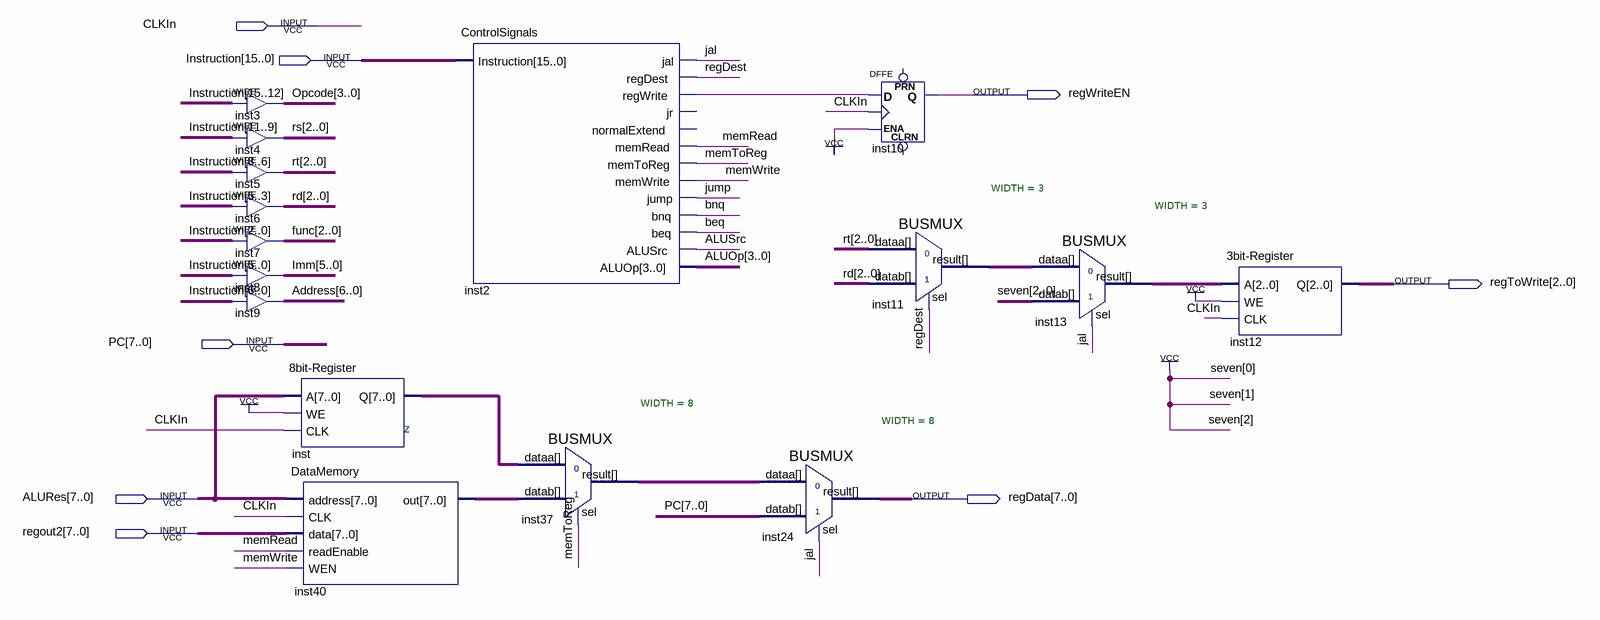
[diagram p0: schematic sheet]
// Quartus schematic Mem.bdf as structural Verilog: 16 symbols, 8 pins
module Mem (
  input  CLKIn,
  input  [15:0] Instruction,
  input  [7:0] PC,
  input  [7:0] ALURes,
  input  [7:0] regout2,
  output regWriteEN,
  output [2:0] regToWrite,
  output [7:0] regData
);

  wire ALUSrc, beq, bnq, inst2_regwrite, jal, jump, memRead, memToReg, memWrite, regDest;
  wire [2:0] func, inst11_result, inst13_result, rd, rs, rt;
  wire [3:0] ALUOp, Opcode;
  wire [5:0] Imm;
  wire [6:0] Address;
  wire [7:0] inst37_result, inst40_out, inst_q;

  assign Opcode = Instruction[15:12];  // WIRE inst3
  assign rs = Instruction[11:9];  // WIRE inst4
  assign rt = Instruction[8:6];  // WIRE inst5
  assign rd = Instruction[5:3];  // WIRE inst6
  assign func = Instruction[2:0];  // WIRE inst7
  assign Imm = Instruction[5:0];  // WIRE inst8
  assign Address = Instruction[6:0];  // WIRE inst9
  \8bit-Register  inst (.A(ALURes), .WE(1'b1), .CLK(CLKIn), .Q(inst_q));
  DataMemory inst40 (
    .address(ALURes), .CLK(CLKIn), .data(regout2), .readEnable(memRead), .WEN(memWrite), .out(inst40_out));
  ControlSignals inst2 (
    .Instruction(Instruction), .jal(jal), .regDest(regDest), .regWrite(inst2_regwrite), .memRead(memRead),
    .memToReg(memToReg), .memWrite(memWrite), .jump(jump), .bnq(bnq), .beq(beq), .ALUSrc(ALUSrc),
    .ALUOp(ALUOp));  // open: jr, normalExtend
  BUSMUX #(.WIDTH(8)) inst37 (.datab(inst40_out), .sel(memToReg), .dataa(inst_q), .result(inst37_result));
  BUSMUX #(.WIDTH(8)) inst24 (.datab(PC), .sel(jal), .dataa(inst37_result), .result(regData));
  DFFE inst10 (.D(inst2_regwrite), .CLK(CLKIn), .ENA(1'b1), .Q(regWriteEN));  // open: PRN, CLRN
  BUSMUX #(.WIDTH(3)) inst11 (.datab(rd), .sel(regDest), .dataa(rt), .result(inst11_result));
  BUSMUX #(.WIDTH(3)) inst13 (.datab(3'b111), .sel(jal), .dataa(inst11_result), .result(inst13_result));
  \3bit-Register  inst12 (.A(inst13_result), .WE(1'b1), .CLK(CLKIn), .Q(regToWrite));

  // Notes on the sheet:
  //   z
endmodule
